# Altium schematic sheet Ground-Fault-Detect-Sheet-3.SchDoc (part 1 of 3)
size 420 x 297 mm; SheetNumber: 9; SheetTotal: 9
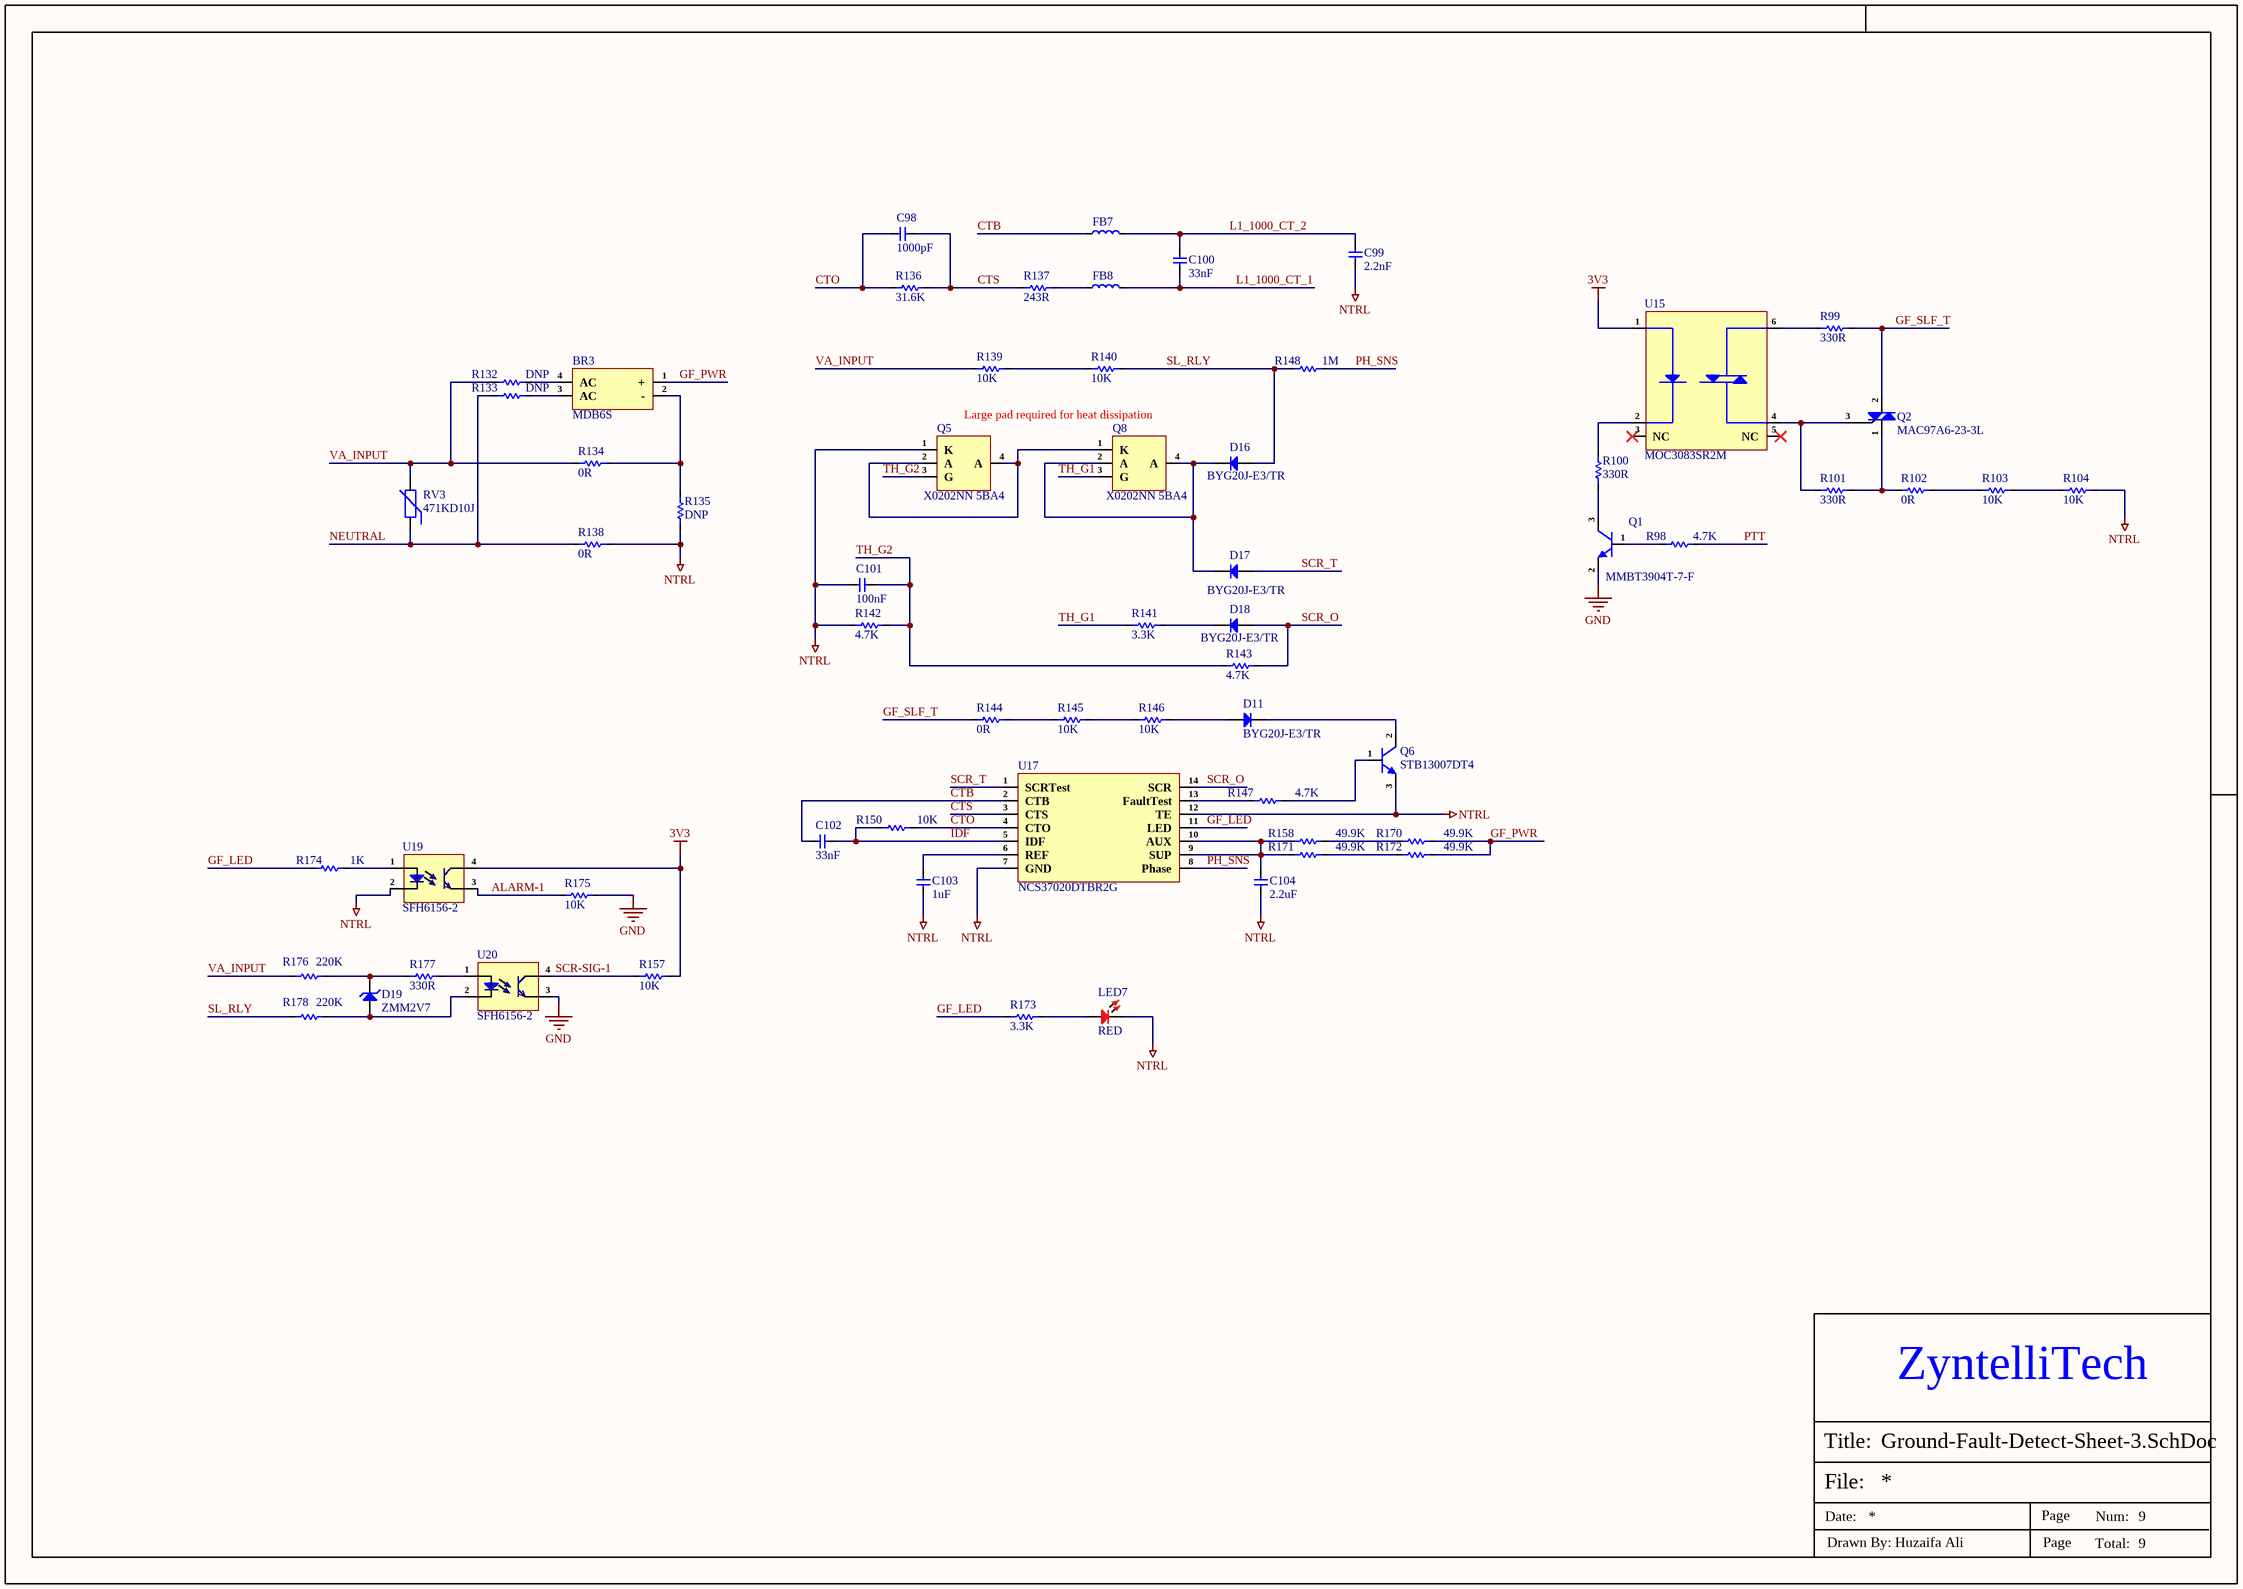
[diagram p0: Ground-Fault-Detect-Sheet-3.SchDoc]

## Parts
BR3  MDB6S  [TSSOP-4(5.0x4.4)]
C98  1000pF  [Cap-0603]
C99  2.2nF  [Cap-0603]
C100  33nF  [Cap-0603]
C101  100nF  [cap-0402]
C102  33nF  [Cap-0603]
C103  1uF  [Cap-0603]
C104  2.2uF  [Cap-0805]
D11  BYG20J-E3/TR  [SMA(DO-214AC)]
D16  BYG20J-E3/TR  [SMA(DO-214AC)]
D17  BYG20J-E3/TR  [SMA(DO-214AC)]
D18  BYG20J-E3/TR  [SMA(DO-214AC)]
D19  ZMM2V7  [LL-34]
FB7  BLM18HE102SN1D  [IND-0603 (1608 Metric)]  (value not drawn)
FB8  BLM18HE102SN1D  [IND-0603 (1608 Metric)]  (value not drawn)
LED7  RED  [LED-0603]
Q1  MMBT3904T-7-F  [SOT-523]
Q2  MAC97A6-23-3L  [SOT-23]
Q5  X0202NN 5BA4  [SOT- 223]
Q6  STB13007DT4  [D2PAK]
Q8  X0202NN 5BA4  [SOT- 223]
R98  4.7K  [Res-0603]
R99  330R  [Res-1206]
R100  330R  [Res-1206]
R101  330R  [Res-1206]
R102  0R  [RES-2512]
R103  10K  [RES-2512]
R104  10K  [RES-2512]
R132  DNP  [Res-0805]
R133  DNP  [Res-0805]
R134  0R  [Res-0805]
R135  DNP  [Res-0805]
R136  31.6K  [Res-1206]
R137  243R  [Res-1206]
R138  0R  [Res-0805]
R139  10K  [RES-2512]
R140  10K  [RES-2512]
R141  3.3K  [Res-0603]
R142  4.7K  [Res-0402]
R143  4.7K  [Res-0402]
R144  0R  [RES-2512]
R145  10K  [RES-2512]
R146  10K  [RES-2512]
R147  4.7K  [Res-0402]
R148  1M  [RES-2010]
R150  10K  [Res-0603]
R157  10K  [Res-0402]
R158  49.9K  [Res-1206]
R170  49.9K  [Res-1206]
R171  49.9K  [Res-1206]
R172  49.9K  [Res-1206]
R173  3.3K  [Res-0603]
R174  1K  [Res-0603]
R175  10K  [Res-0402]
R176  220K  [Res-1206]
R177  330R  [Res-1206]
R178  220K  [Res-1206]
RV3  471KD10J  [471KD10J]
U15  MOC3083SR2M  [SMD-6P]
U17  NCS37020DTBR2G  [14-TSSOP]
U19  SFH6156-2  [SFH6156-2]
U20  SFH6156-2  [SFH6156-2]

## Nets
3V3: R157.1 U15.1 U19.4(C)
GND: Q1.2(E) R175.1 U20.3(E)
NTRL: C99.1 C101.1 C103.1 C104.1 LED7.2 Q5.1(K) Q6.3(E) R104.2 R135.1 R138.2 R142.1 U17.7(GND) U17.12(TE) U19.2(Ca)
ALARM-1: R175.2 U19.3(E)
CTB: C102.2 FB7.1 U17.2(CTB)
CTO: C98.1 R136.1 R150.2 U17.4(CTO)
CTS: C98.2 R136.2 R137.1 U17.3(CTS)
GF_LED: R173.1 R174.1 U17.11(LED)
GF_PWR: BR3.1(+) R170.2 R172.2
GF_SLF_T: Q2.2(T2) R99.2 R144.1
IDF: C102.1 R150.1 U17.5(IDF)
L1_1000_CT_1: C100.2 FB8.2
L1_1000_CT_2: C99.2 C100.1 FB7.2
NEUTRAL: R133.1 R138.1 RV3.1
PH_SNS: R148.2 U17.8(Phase)
PTT: R98.2
SCR-SIG-1: R157.2 U20.4(C)
SCR_O: D18.2(A) R143.2 U17.14(SCR)
SCR_T: D17.2(A) U17.1(SCRTest)
SL_RLY: D16.2(A) R140.2 R148.1 R178.2
TH_G1: Q8.3(G) R141.2
TH_G2: C101.2 Q5.3(G) R142.2 R143.1
VA_INPUT: R132.1 R134.1 R139.1 R176.2 RV3.2
NetBR3_2: BR3.2(-) R134.2 R135.2
NetBR3_3: BR3.3(AC) R133.2
NetBR3_4: BR3.4(AC) R132.2
NetC103_2: C103.2 U17.6(REF)
NetC104_2: C104.2 R158.1 R171.1 U17.9(SUP) U17.10(AUX)
NetD11_1: D11.1(K) Q6.2(C)
NetD11_2: D11.2(A) R146.2
NetD16_1: D16.1(K) D17.1(K) Q8.2(A) Q8.4(A)
NetD18_1: D18.1(K) R141.1
NetD19_1: D19.1(K) R176.1 R177.1
NetD19_2: D19.2(A) R178.1 U20.2(Ca)
NetFB8_1: FB8.1 R137.2
NetLED7_1: LED7.1 R173.2
NetQ1_1: Q1.1(B) R98.1
NetQ1_3: Q1.3(C) R100.1
NetQ2_1: Q2.1(T1) R101.2 R102.1
NetQ2_3: Q2.3(G) R101.1 U15.4
NetQ5_2: Q5.2(A) Q5.4(A) Q8.1(K)
NetQ6_1: Q6.1(B) R147.2
NetR99_1: R99.1 U15.6
NetR100_2: R100.2 U15.2
NetR102_2: R102.2 R103.1
NetR103_2: R103.2 R104.1
NetR139_2: R139.2 R140.1
NetR144_2: R144.2 R145.1
NetR145_2: R145.2 R146.1
NetR147_1: R147.1 U17.13(FaultTest)
NetR158_2: R158.2 R170.1
NetR171_2: R171.2 R172.1
NetR174_2: R174.2 U19.1(An)
NetR177_2: R177.2 U20.1(An)

Not connected (* = marked no-connect by the designer): U15 3(NC)* 5(NC)*

## Notes on the sheet
- Large pad required for heat dissipation
- ZyntelliTech
- File:
- Title:
- Date:
- Page
- Num:
- Total:
- Drawn By: Huzaifa Ali